# Altium schematic sheet P1.schdoc
size 297 x 209 mm; Symbol: Drawing-Symbol_A4; @Project Name: NAI-Lucifer PCB; @Page Count: 1; @Update Date: 2026-11-11; @Create Date: 2026-11-11; @Schematic Name: Schematic2; @Page No: 1; @Page Name: P1; Company: EasyEDA.com; Version: V1.0; Page Size: A4; Device: Drawing-Symbol_A4; @Create Time: 21:58:18; @Update Time: 21:58:18; Border: 1; Width: 1170; Height: 825; Region Start: 1; X Region Count: 6; Y Region Count: 4; Blade Width: 10; Title Block Position: 3
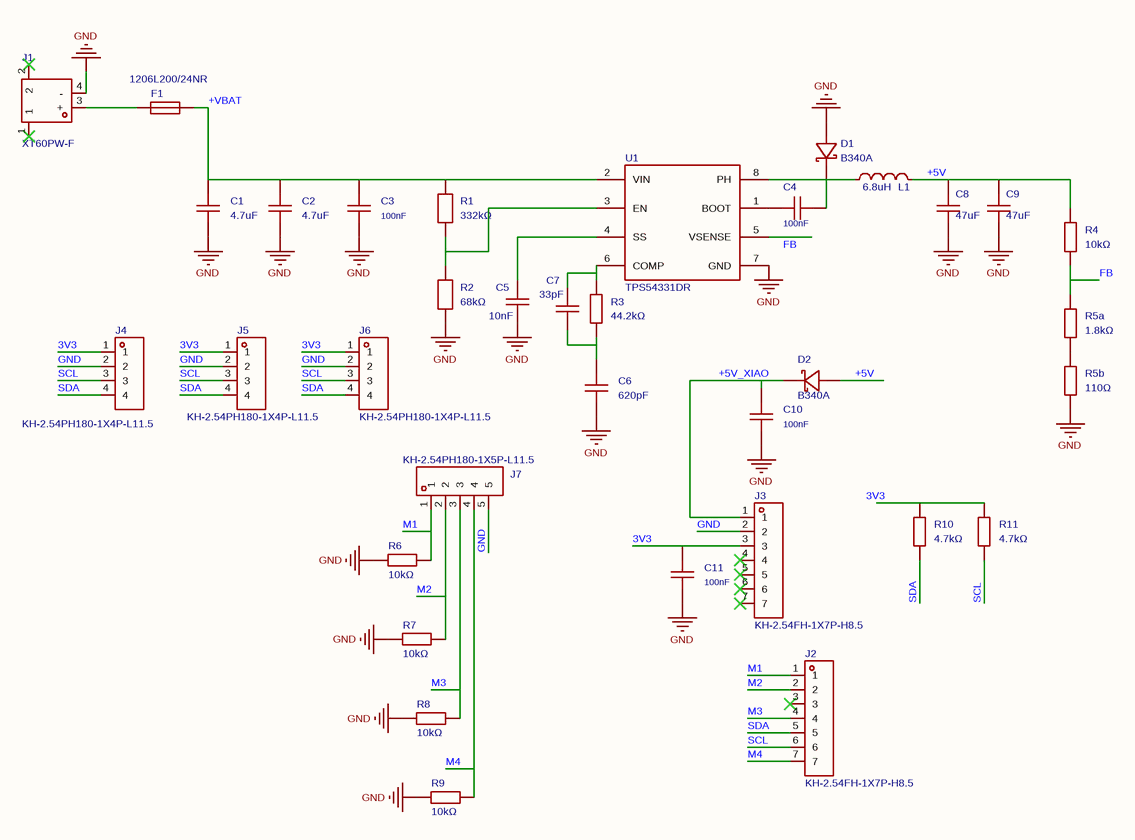
[diagram p0: P1.schdoc]

## Parts
C1  4.7uF  [C1210]
C2  4.7uF  [C1210]
C3  100nF  [C0603]
C4  100nF  [C0603]
C5  10nF  [C0603]
C6  620pF  [C0603]
C7  33pF  [C0603]
C8  47uF  [C1206]
C9  47uF  [C1206]
C10  100nF  [C0603]
C11  100nF  [C0603]
D1  B340A  [SMA_L4.3-W2.6-LS5.0-RD]
D2  B340A  [SMA_L4.3-W2.6-LS5.0-RD]
F1  1206L200/24NR  [F1206]
J1  XT60PW-F  [TH_2P-XT60PW-F]
J2  KH-2.54FH-1X7P-H8.5  [HDR-TH_7P-P2.54-V-F]
J3  KH-2.54FH-1X7P-H8.5  [HDR-TH_7P-P2.54-V-F]
J4  KH-2.54PH180-1X4P-L11.5  [HDR-TH_4P-P2.54-V-M]
J5  KH-2.54PH180-1X4P-L11.5  [HDR-TH_4P-P2.54-V-M]
J6  KH-2.54PH180-1X4P-L11.5  [HDR-TH_4P-P2.54-V-M]
J7  KH-2.54PH180-1X5P-L11.5  [HDR-TH_5P-P2.54-V-M]
L1  6.8uH  [IND-SMD_L7.0-W6.6]
R1  332kΩ  [R0603]
R2  68kΩ  [R0603]
R3  44.2kΩ  [R0603]
R4  10kΩ  [R0603]
R5a  1.8kΩ  [R0603]
R5b  110Ω  [R0603]
R6  10kΩ  [R0603]
R7  10kΩ  [R0603]
R8  10kΩ  [R0603]
R9  10kΩ  [R0603]
R10  4.7kΩ  [R0603]
R11  4.7kΩ  [R0603]
U1  TPS54331DR  [SOIC-8_L5.0-W4.0-P1.27-LS6.0-BL]

## Nets
GND: C1.2 C2.1 C3.1 C5.1 C6.1 C8.1 C9.2 C10.1 C11.1 D1.2(A) J1.4(-) J3.2 J4.2 J5.2 J6.2 J7.5 R2.1 R5b.1 R6.1 R7.2 R8.1 R9.1 U1.7(GND)
3V3: C11.2 J3.3 J4.1 J5.1 J6.1 R10.2 R11.2
+5V: C8.2 C9.1 D2.2(A) L1.2 R4.2
+5V_XIAO: C10.2 D2.1(K) J3.1
+VBAT: C1.1 C2.2 C3.2 F1.2 R1.2 U1.2(VIN)
FB: R4.1 R5a.2 U1.5(VSENSE)
M1: J2.1 J7.1 R6.2
M2: J2.2 J7.2 R7.1
M3: J2.4 J7.3 R8.2
M4: J2.7 J7.4 R9.2
SCL: J2.6 J4.3 J5.3 J6.3 R11.1
SDA: J2.5 J4.4 J5.4 J6.4 R10.1
NetC4_1: C4.1 D1.1(K) L1.1 U1.8(PH)
NetC4_2: C4.2 U1.1(BOOT)
NetC5_2: C5.2 U1.4(SS)
NetC6_2: C6.2 C7.1 R3.1
NetC7_2: C7.2 R3.2 U1.6(COMP)
NetF1_1: F1.1 J1.3(+)
NetR1_1: R1.1 R2.2 U1.3(EN)
NetR5a_1: R5a.1 R5b.2

Not connected (* = marked no-connect by the designer): J1 1* 2*; J2 3*; J3 4* 5* 6* 7*

## Notes on the sheet
- Create at
- 2026-11-11
- Schematic
- Board
- Schematic2
- Update at
- Page
- P1
- Drawn
- Reviewed
- NAI-Lucifer PCB
- Version
- V1.0
- Size
- A4
- Page  1  Total  1
- EasyEDA.com

## Library data of the parts
C1 = C1210C475K5RACTU: Capacitance:4.7uF Tolerance:±10% Tolerance:±10% Voltage Rating:50V Temperature Coefficient:X7R; Manufacturer: KEMET(基美); Check: true; AddInBom: yes; ModelId: 9bc01558702f4bd6b0b47bb74017b6c50819f05c4eef4c71ace90d822a990e87; ModelName: C1210_L3.2-W2.5-H2.5; ModelTransform: 125.984,98.425,0,0,0,0,0,0,0; Tolerance: ±10%; Voltage Rating: 50V; Temperature Coefficient: X7R; Symbol: C1210C475K5RACTU; Device: C1210C475K5RACTU; LCSC Part Name: 4.7uF ±10% 50V; SupplierPart: C2182224; ManufacturerPart: C1210C475K5RACTU; Supplier Footprint: 1210; JLCPCB Part Class: Extended Part; Datasheet: https://item.szlcsc.com/datasheet/C1210C475K5RACTU/2274291.html; Supplier: LCSC; ConvertToPcb: yes; FootprintName: C1210; Value: 4.7uF
C2 = C1210C475K5RACTU: Capacitance:4.7uF Tolerance:±10% Tolerance:±10% Voltage Rating:50V Temperature Coefficient:X7R; Manufacturer: KEMET(基美); Check: true; 3D Model: 9bc01558702f4bd6b0b47bb74017b6c50819f05c4eef4c71ace90d822a990e87; 3D Model Transform: 125.984,98.425,0,0,0,0,0,0,0; Tolerance: ±10%; Voltage Rating: 50V; Temperature Coefficient: X7R; AddInBom: yes; ModelName: C1210_L3.2-W2.5-H2.5; Symbol: C1210C475K5RACTU; Device: C1210C475K5RACTU; LCSC Part Name: 4.7uF ±10% 50V; Supplier Part: C2182224; Manufacturer Part: C1210C475K5RACTU; Supplier Footprint: 1210; JLCPCB Part Class: Extended Part; Datasheet: https://item.szlcsc.com/datasheet/C1210C475K5RACTU/2274291.html; Supplier: LCSC; Value: 4.7uF; ConvertToPcb: yes; FootprintName: C1210
C3 C4 C10 C11 = CC0603KRX7R9BB104: Capacitance:100nF Tolerance:±10% Tolerance:±10% Voltage Rating:50V Temperature Coefficient:X7R; Manufacturer: YAGEO(国巨); Check: true; 3D Model: 624118aa3cc7497086c383c2d72e08520819f05c4eef4c71ace90d822a990e87; 3D Model Transform: 62.992,31.496,0,0,0,0,0,0,0; Tolerance: ±10%; Voltage Rating: 50V; Temperature Coefficient: X7R; AddInBom: yes; ModelName: C0603_L1.6-W0.8-H0.8; Symbol: CC0603KRX7R9BB104; Device: CC0603KRX7R9BB104; LCSC Part Name: 100nF ±10% 50V; Supplier Part: C14663; Manufacturer Part: CC0603KRX7R9BB104; Supplier Footprint: 0603; JLCPCB Part Class: Basic Part; Datasheet: https://item.szlcsc.com/datasheet/CC0603KRX7R9BB104/15331.html; Supplier: LCSC; Value: 100nF; ConvertToPcb: yes; FootprintName: C0603
C5 = CL10B103KB8NNNC: Capacitance:10nF Tolerance:±10% Tolerance:±10% Voltage Rating:50V Temperature Coefficient:X7R; Manufacturer: SAMSUNG(三星); Check: true; 3D Model: 624118aa3cc7497086c383c2d72e08520819f05c4eef4c71ace90d822a990e87; 3D Model Transform: 62.992,31.496,0,0,0,0,0,0,0; Tolerance: ±10%; Voltage Rating: 50V; Temperature Coefficient: X7R; AddInBom: yes; ModelName: C0603_L1.6-W0.8-H0.8; Symbol: CL10B103KB8NNNC; Device: CL10B103KB8NNNC; LCSC Part Name: 10nF ±10% 50V; Supplier Part: C1589; Manufacturer Part: CL10B103KB8NNNC; Supplier Footprint: 0603; JLCPCB Part Class: Extended Part; Datasheet: https://item.szlcsc.com/datasheet/CL10B103KB8NNNC/1941.html; Supplier: LCSC; Value: 10nF; ConvertToPcb: yes; FootprintName: C0603
C6 = GRM1885C1H621JA01D: Capacitance: Tolerance:±5% Tolerance:±5% Voltage Rated: Temperature Coefficient:; Manufacturer: muRata(村田); Check: true; AddInBom: yes; ModelId: 624118aa3cc7497086c383c2d72e08520819f05c4eef4c71ace90d822a990e87; ModelName: C0603_L1.6-W0.8-H0.8; ModelTransform: 62.992,31.496,0,0,0,0,0,0,0; Tolerance: ±5%; Symbol: GRM1885C1H621JA01D; Device: GRM1885C1H621JA01D; LCSC Part Name: 620pF ±5% 50V; SupplierPart: C527998; ManufacturerPart: GRM1885C1H621JA01D; Supplier Footprint: 0603; JLCPCB Part Class: Extended Part; Datasheet: https://atta.szlcsc.com/upload/public/pdf/source/20200407/C503309_0211D99E6F86B2657E389DD3F8367252.pdf; Supplier: LCSC; ConvertToPcb: yes; FootprintName: C0603; Value: 620pF
C7 = CL10C330JB8NNNC: Capacitance:33pF Tolerance:±5% Tolerance:±5% Voltage Rating:50V Temperature Coefficient:C0G; Manufacturer: SAMSUNG(三星); Check: true; AddInBom: yes; ModelId: 624118aa3cc7497086c383c2d72e08520819f05c4eef4c71ace90d822a990e87; ModelName: C0603_L1.6-W0.8-H0.8; ModelTransform: 62.992,31.496,0,0,0,0,0,0,0; Tolerance: ±5%; Voltage Rating: 50V; Temperature Coefficient: C0G; Symbol: CL10C330JB8NNNC; Device: CL10C330JB8NNNC; Supplier: LCSC; Manufacturer Part: CL10C330JB8NNNC; Value: 33pF; Supplier Part: C1663; JLCPCB Part Class: Basic Part; LCSC Part Name: 33pF ±5% 50V; Supplier Footprint: 0603; Datasheet: https://item.szlcsc.com/datasheet/CL10C330JB8NNNC/2015.html; ConvertToPcb: yes; FootprintName: C0603
C8 = CL31A476MPHNNNE: Capacitance:47uF Tolerance:±20% Tolerance:±20% Voltage Rating:10V Temperature Coefficient:X5R; Manufacturer: SAMSUNG(三星); Check: true; 3D Model: c6790e9475e1483991d2c64340b24e960819f05c4eef4c71ace90d822a990e87; 3D Model Transform: 125.984,62.992,0,0,0,0,0,0,0; Tolerance: ±20%; Voltage Rating: 10V; Temperature Coefficient: X5R; AddInBom: yes; ModelName: C1206_L3.2-W1.6-H1.3; Symbol: CL31A476MPHNNNE; Device: CL31A476MPHNNNE; LCSC Part Name: 47uF ±20% 10V; Supplier Part: C96123; Manufacturer Part: CL31A476MPHNNNE; Supplier Footprint: 1206; JLCPCB Part Class: Basic Part; Datasheet: https://item.szlcsc.com/datasheet/CL31A476MPHNNNE/97327.html; Supplier: LCSC; Value: 47uF; ConvertToPcb: yes; FootprintName: C1206
C9 = CL31A476MPHNNNE: Capacitance:47uF Tolerance:±20% Tolerance:±20% Voltage Rating:10V Temperature Coefficient:X5R; Manufacturer: SAMSUNG(三星); Check: true; AddInBom: yes; ModelId: c6790e9475e1483991d2c64340b24e960819f05c4eef4c71ace90d822a990e87; ModelName: C1206_L3.2-W1.6-H1.3; ModelTransform: 125.984,62.992,0,0,0,0,0,0,0; Tolerance: ±20%; Voltage Rating: 10V; Temperature Coefficient: X5R; Symbol: CL31A476MPHNNNE; Device: CL31A476MPHNNNE; LCSC Part Name: 47uF ±20% 10V; SupplierPart: C96123; ManufacturerPart: CL31A476MPHNNNE; Supplier Footprint: 1206; JLCPCB Part Class: Basic Part; Datasheet: https://item.szlcsc.com/datasheet/CL31A476MPHNNNE/97327.html; Supplier: LCSC; ConvertToPcb: yes; FootprintName: C1206; Value: 47uF
D1 D2 = B340A_C3018525: Forward Voltage (Vf@If):550mV@3A Reverse Voltage (Vr):40V Average Rectified Current (Io):3A Reverse Leakage Current (Ir):500uA@40V; Manufacturer: FUXINSEMI(富芯森美); Check: true; AddInBom: yes; ModelId: 350a5e503cd74372b99758d92a4eb3ec0819f05c4eef4c71ace90d822a990e87; ModelTransform: 196.85,102.362,0,0,0,0,0,0,0; Reverse Voltage (Vr): 40V; Average Rectified Current (Io): 3A; Symbol: B340A_C3018525; Device: B340A_C3018525; LCSC Part Name: 电压:40V 电流:3A; SupplierPart: C3018525; ManufacturerPart: B340A; Supplier Footprint: SMA(DO-214AC); JLCPCB Part Class: Extended Part; Datasheet: https://atta.szlcsc.com/upload/public/pdf/source/20220530/48889337C27311960E6F9D350CFD44EF.pdf; Supplier: LCSC; ConvertToPcb: yes; FootprintName: SMA_L4.3-W2.6-LS5.0-RD; ModelName: SMA_L4.3-W2.6-LS5.0-RD; Forward Voltage (Vf@If): 550mV@3A; Reverse Leakage Current (Ir): 500uA@40V
F1 = 1206L200/24NR: Voltage - Max:24V Current - Max:40A Hold Current:2A Trip Current:3.5A Power Dissipation:1.2W Resistance - Initial (Ri) (Min):15mΩ Resistance - Post Trip (R1) (Max):80mΩ Time to Trip(Max):1.5s Operating Temperature:-40℃~+85℃ Operating Temperature:-40℃~+85℃; Manufacturer: LUTE(陆特); Check: true; AddInBom: yes; ModelId: 61372169742747e19cbd4ac5ee5e48b10819f05c4eef4c71ace90d822a990e87; ModelName: F1206_L3.2-W1.7-H0.6; ModelTransform: 125.984,66.929,0,0,0,0,0,0,0; Voltage - Max: 24V; Current - Max: 40A; Hold Current: 2A; Trip Current: 3.5A; Power Dissipation: 1.2W; Resistance - Initial (Ri) (Min): 15mΩ; Resistance - Post Trip (R1) (Max): 80mΩ; Time to Trip(Max): 1.5s; Symbol: 1206L200/24NR; Device: 1206L200/24NR; LCSC Part Name: 24V 2.00A 1206 自恢复; SupplierPart: C42396578; ManufacturerPart: 1206L200/24NR; Supplier Footprint: 1206; JLCPCB Part Class: Extended Part; Datasheet: https://item.szlcsc.com/datasheet/1206L200%252F24NR/44344788.html; Supplier: LCSC; ConvertToPcb: yes; FootprintName: F1206; Operating Temperature: -40℃~+85℃; Length: 3.6mm; Width: 1.9mm; Height: 1.6mm; Pitch: -
J1 = XT60PW-F: colour:Yellow Connector type:Horizontal plug interface form:Female; Manufacturer: AMASS(艾迈斯); Check: true; Symbol: XT60PW-F_C428722; AddInBom: yes; ModelId: 5394980244ce4cef9ccf9501250f7db70819f05c4eef4c71ace90d822a990e87; ModelTransform: 610.235,677.164,0,0,0,0,-2.4,150.43,-149.606; interface form: Female; Device: XT60PW-F; LCSC Part Name: AMASS(艾迈斯)插头锂电池组充电接头 线到板连接器大电流30A连接器 航模电调卧式焊板 母头XT60PW-F.G.Y; SupplierPart: C428722; ManufacturerPart: XT60PW-F; Supplier Footprint: -; JLCPCB Part Class: Extended Part; Datasheet: https://item.szlcsc.com/datasheet/XT60PW-F/423834.html; Supplier: LCSC; ConvertToPcb: yes; FootprintName: TH_2P-XT60PW-F; ModelName: TH_2P-XT60PW-F; colour: Yellow; Connector type: Horizontal plug
J2 J3 = KH-2.54FH-1X7P-H8.5: Holes Structure:1x7P Pitch:2.54mm Row Spacing:- Circular Hole / Square Hole:Square Hole Mounting Type:Through Hole Number of Rows:1 Number of Positions:7P Current Rating:3A Voltage Rating (Max):- Holes Direction:Top Insulation Height:8.5mm Contact Materia; Manufacturer: kinghelm(金航标); Check: true; AddInBom: yes; ModelId: 12ee6e43c8c540869f0518a7af89635d0819f05c4eef4c71ace90d822a990e87; ModelName: HDR-TH_7P-P2.54-F-LI-1X7P; ModelTransform: 715.7466,94.488,0,0,0,0,0,0,-118.11; Holes Structure: 1x7P; Pitch: 2.54mm; Number of Positions: 7P; Current Rating: 3A; Holes Direction: Top; PIN Length: 3mm; Symbol: KH-2.54FH-1X7P-H8.5; Device: KH-2.54FH-1X7P-H8.5; LCSC Part Name: 1x7P 间距:2.54mm 直插; SupplierPart: C2932672; ManufacturerPart: KH-2.54FH-1X7P-H8.5; Supplier Footprint: 插件,P=2.54mm; JLCPCB Part Class: Extended Part; Datasheet: https://item.szlcsc.com/datasheet/KH-2.54FH-1X7P-H8.5/3278193.html; Supplier: LCSC; ConvertToPcb: yes; FootprintName: HDR-TH_7P-P2.54-V-F; Row Spacing: -; Circular Hole / Square Hole: Square Hole; Mounting Type: Through Hole; Number of Rows: 1; Voltage Rating (Max): -; Insulation Height: 8.5mm; Contact Material: Brass; Contact Plating: Gold; Operating Temperature: -40℃~+105℃
J4-J6 = KH-2.54PH180-1X4P-L11.5: Pin Structure:1x4P Pitch:2.54mm Row Spacing:- Circluar Pins/Square Pins:Pin Header Mounting Type:Through Hole Number of Rows:1 Number of Pins:4P Current Rating:3A Voltage Rating (Max):- Length of Mating Pin:6mm Insulation Height:2.5mm Length of End Connec; Manufacturer: kinghelm(金航标); Check: true; AddInBom: yes; ModelId: 69e0934d9b9245f6ab499bc5a319b3aa0819f05c4eef4c71ace90d822a990e87; ModelName: HDR-TH_4P-P2.54-M-LI-1X4P; ModelTransform: 399.999,104.7242,0,0,0,0,0,0,-118.11; Pin Structure: 1x4P; Pitch: 2.54mm; Current Rating: 3A; Symbol: KH-2.54PH180-1X4P-L11.5; Device: KH-2.54PH180-1X4P-L11.5; LCSC Part Name: 1x4P 间距:2.54mm 方针 直插; SupplierPart: C2905435; ManufacturerPart: KH-2.54PH180-1X4P-L11.5; Supplier Footprint: 插件,P=2.54mm; JLCPCB Part Class: Extended Part; Datasheet: https://item.szlcsc.com/datasheet/KH-2.54PH180-1X4P-L11.5/3175223.html; Supplier: LCSC; ConvertToPcb: yes; FootprintName: HDR-TH_4P-P2.54-V-M; Row Spacing: -; Circluar Pins/Square Pins: Pin Header; Mounting Type: Through Hole; Number of Rows: 1; Number of Pins: 4P; Voltage Rating (Max): -; Length of Mating Pin: 6mm; Insulation Height: 2.5mm; Length of End Connection Pin: 3mm; Contact Material: -; Operating Temperature: -40℃~+105℃; Color: Black
J7 = KH-2.54PH180-1X5P-L11.5: Pin Structure:1x5P Pitch:2.54mm Row Spacing:- Circluar Pins/Square Pins:Pin Header Mounting Type:Through Hole Number of Rows:1 Number of Pins:5P Current Rating:3A Voltage Rating (Max):- Length of Mating Pin:6mm Insulation Height:2.5mm Length of End Connec; Manufacturer: kinghelm(金航标); Check: true; AddInBom: yes; ModelId: 98c612b43cbb479a86eae3328ff22ecc0819f05c4eef4c71ace90d822a990e87; ModelName: HDR-TH_5P-P2.54-M-LI-1X5P; ModelTransform: 499.999,100,0,0,0,0,0,0,-118.11; Pin Structure: 1x5P; Pitch: 2.54mm; Current Rating: 3A; Symbol: KH-2.54PH180-1X5P-L11.5; Device: KH-2.54PH180-1X5P-L11.5; LCSC Part Name: 1x5P 间距:2.54mm 方针 直插; SupplierPart: C2932699; ManufacturerPart: KH-2.54PH180-1X5P-L11.5; Supplier Footprint: 插件,P=2.54mm; JLCPCB Part Class: Extended Part; Datasheet: https://item.szlcsc.com/datasheet/KH-2.54PH180-1X5P-L11.5/3278220.html; Supplier: LCSC; ConvertToPcb: yes; FootprintName: HDR-TH_5P-P2.54-V-M; Row Spacing: -; Circluar Pins/Square Pins: Pin Header; Mounting Type: Through Hole; Number of Rows: 1; Number of Pins: 5P; Voltage Rating (Max): -; Length of Mating Pin: 6mm; Insulation Height: 2.5mm; Length of End Connection Pin: 3mm; Operating Temperature: -40℃~+105℃; Color: Black
L1 = TMPC0624H-6R8MG-D: Inductance: Tolerance:±20% Tolerance:±20% Rated Current: Saturation Current (Isat):7A DC Resistance (DCR):; Manufacturer: TAI-TECH(台庆); Check: true; AddInBom: yes; ModelId: c5f8ba9cccaa467b9f226b80eb77c8b30819f05c4eef4c71ace90d822a990e87; ModelName: IND-SMD_L7.0-W6.6-H3.0; ModelTransform: 275.59,259.88137,0,0,0,0,0,0,0; Tolerance: ±20%; Saturation Current (Isat): 7A; Symbol: TMPC0624H-6R8MG-D; Device: TMPC0624H-6R8MG-D; LCSC Part Name: 6.8uH ±20% 7A; SupplierPart: C357230; ManufacturerPart: TMPC0624H-6R8MG-D; Supplier Footprint: SMD,7x6.6mm; JLCPCB Part Class: Extended Part; Datasheet: https://atta.szlcsc.com/upload/public/pdf/source/20200917/C357230_D0E636AD8F4F6E55E8FC0BE9190F699A.pdf; Supplier: LCSC; ConvertToPcb: yes; FootprintName: IND-SMD_L7.0-W6.6; Value: 6.8uH
R1 = RMCF0603FT332K: Type:Thick Film Resistor Resistance:332kΩ Tolerance:±1% Tolerance:±1% Power(Watts):100mW Temperature Coefficient:±100ppm/℃ Temperature Coefficient:±100ppm/℃ Operating Temperature:-55℃~+155℃ Operating Temperature:-55℃~+155℃; Manufacturer: SEI(Stackpole Electronics Inc.); Check: true; AddInBom: yes; ModelId: 112863783b5b41f1b5254f87eedc79320819f05c4eef4c71ace90d822a990e87; ModelTransform: 31.8897,63.7794,0,90,0,0,0,0,0; Tolerance: ±1%; Power(Watts): 100mW; Symbol: RMCF0603FT332K; Device: RMCF0603FT332K; LCSC Part Name: 厚膜电阻 332kΩ ±1% 100mW; SupplierPart: C3994408; ManufacturerPart: RMCF0603FT332K; Supplier Footprint: 0603; JLCPCB Part Class: Extended Part; Datasheet: https://item.szlcsc.com/datasheet/RMCF0603FT332K/4563600.html; Supplier: LCSC; ConvertToPcb: yes; FootprintName: R0603; ModelName: R0603; Type: Thick Film Resistor; Value: 332kΩ; Temperature Coefficient: ±100ppm/℃; Operating Temperature: -55℃~+155℃
R2 = FRC0603F6802TS: Type:Thick Film Resistor Resistance:68kΩ Tolerance:±1% Tolerance:±1% Power(Watts):100mW Voltage-Supply(Max):75V Temperature Coefficient:±100ppm/℃ Temperature Coefficient:±100ppm/℃ Operating Temperature:-55℃~+155℃ Operating Temperature:-55℃~+155℃; Manufacturer: FOJAN(富捷); Check: true; AddInBom: yes; ModelId: 112863783b5b41f1b5254f87eedc79320819f05c4eef4c71ace90d822a990e87; ModelTransform: 31.8897,63.7794,0,90,0,0,0,0,0; Tolerance: ±1%; Power(Watts): 100mW; Voltage-Supply(Max): 75V; Symbol: FRC0603F6802TS; Device: FRC0603F6802TS; LCSC Part Name: 68kΩ ±1% 100mW 厚膜电阻; SupplierPart: C2907063; ManufacturerPart: FRC0603F6802TS; Supplier Footprint: 0603; JLCPCB Part Class: Extended Part; Supplier: LCSC; ConvertToPcb: yes; FootprintName: R0603; ModelName: R0603; Type: Thick Film Resistor; Value: 68kΩ; Temperature Coefficient: ±100ppm/℃; Operating Temperature: -55℃~+155℃
R3 = RK73H1JTTD4422F: Type:Thick Film Resistor Resistance:44.2kΩ Tolerance:±1% Tolerance:±1% Power(Watts):100mW Voltage-Supply(Max):75V Temperature Coefficient:±100ppm/℃ Temperature Coefficient:±100ppm/℃ Operating Temperature:-55℃~+155℃ Operating Temperature:-55℃~+155℃; Manufacturer: KOA; Check: true; AddInBom: yes; ModelId: 112863783b5b41f1b5254f87eedc79320819f05c4eef4c71ace90d822a990e87; ModelTransform: 31.8897,63.7794,0,90,0,0,0,0,0; Tolerance: ±1%; Power(Watts): 100mW; Voltage-Supply(Max): 75V; Symbol: RK73H1JTTD4422F; Device: RK73H1JTTD4422F; LCSC Part Name: 厚膜电阻 44.2kΩ ±1% 100mW; SupplierPart: C317170; ManufacturerPart: RK73H1JTTD4422F; Supplier Footprint: 0603; JLCPCB Part Class: Extended Part; Datasheet: https://item.szlcsc.com/datasheet/RK73H1JTTD4422F/298752.html; Supplier: LCSC; ConvertToPcb: yes; FootprintName: R0603; ModelName: R0603; Type: Thick Film Resistor; Value: 44.2kΩ; Temperature Coefficient: ±100ppm/℃; Operating Temperature: -55℃~+155℃
R4 R6-R9 = 0603WAF1002T5E: Type:Thick Film Resistor Resistance:10kΩ Tolerance:±1% Tolerance:±1% Power(Watts):100mW Voltage-Supply(Max):75V Temperature Coefficient:±100ppm/℃ Temperature Coefficient:±100ppm/℃ Operating Temperature:-55℃~+155℃ Operating Temperature:-55℃~+155℃; Manufacturer: UNI-ROYAL(厚声); Check: true; 3D Model: 112863783b5b41f1b5254f87eedc79320819f05c4eef4c71ace90d822a990e87; 3D Model Transform: 31.8897,63.7794,0,90,0,0,0,0,0; Tolerance: ±1%; Power(Watts): 100mW; Voltage-Supply(Max): 75V; AddInBom: yes; Symbol: 0603WAF1002T5E; Device: 0603WAF1002T5E; LCSC Part Name: 厚膜电阻 10kΩ ±1% 100mW; Supplier Part: C25804; Manufacturer Part: 0603WAF1002T5E; Supplier Footprint: 0603; JLCPCB Part Class: Basic Part; Datasheet: https://item.szlcsc.com/datasheet/0603WAF1002T5E/26547.html; Supplier: LCSC; Type: Thick Film Resistor; Value: 10kΩ; Temperature Coefficient: ±100ppm/℃; Operating Temperature: -55℃~+155℃; ConvertToPcb: yes; FootprintName: R0603; ModelName: R0603
R5a = 0603WAF1801T5E: Type:Thick Film Resistor Resistance:1.8kΩ Tolerance:±1% Tolerance:±1% Power(Watts):100mW Voltage-Supply(Max):75V Temperature Coefficient:±100ppm/℃ Temperature Coefficient:±100ppm/℃ Operating Temperature:-55℃~+155℃ Operating Temperature:-55℃~+155℃; Manufacturer: UNI-ROYAL(厚声); Check: true; AddInBom: yes; ModelId: 112863783b5b41f1b5254f87eedc79320819f05c4eef4c71ace90d822a990e87; ModelTransform: 31.8897,63.7794,0,90,0,0,0,0,0; Tolerance: ±1%; Power(Watts): 100mW; Voltage-Supply(Max): 75V; Symbol: 0603WAF1801T5E; Device: 0603WAF1801T5E; Supplier: LCSC; Manufacturer Part: 0603WAF1801T5E; Supplier Part: C4177; Value: 1.8kΩ; JLCPCB Part Class: Basic Part; LCSC Part Name: 厚膜电阻 1.8kΩ ±1%; Supplier Footprint: 0603; Datasheet: https://item.szlcsc.com/datasheet/0603WAF1801T5E/4584.html; ConvertToPcb: yes; FootprintName: R0603; ModelName: R0603; Type: Thick Film Resistor; Temperature Coefficient: ±100ppm/℃; Operating Temperature: -55℃~+155℃
R5b = HPCR0603F110RK9: Type:Thick Film Resistor Resistance:110Ω Tolerance:±1% Tolerance:±1% Power(Watts):125mW Voltage-Supply(Max):50V Temperature Coefficient:±100ppm/℃ Temperature Coefficient:±100ppm/℃ Operating Temperature:-55℃~+125℃ Operating Temperature:-55℃~+125℃; Manufacturer: RESI(开步睿思); Check: true; AddInBom: yes; ModelId: 112863783b5b41f1b5254f87eedc79320819f05c4eef4c71ace90d822a990e87; ModelTransform: 31.8897,63.7794,0,90,0,0,0,0,0; Tolerance: ±1%; Power(Watts): 125mW; Voltage-Supply(Max): 50V; Symbol: HPCR0603F110RK9; Device: HPCR0603F110RK9; LCSC Part Name: 厚膜电阻 110Ω ±1% 125mW; SupplierPart: C365068; ManufacturerPart: HPCR0603F110RK9; Supplier Footprint: 0603; JLCPCB Part Class: Extended Part; Datasheet: https://item.szlcsc.com/datasheet/HPCR0603F110RK9/339284.html; Supplier: LCSC; ConvertToPcb: yes; FootprintName: R0603; ModelName: R0603; Type: Thick Film Resistor; Value: 110Ω; Temperature Coefficient: ±100ppm/℃; Operating Temperature: -55℃~+125℃
R10 R11 = 0603WAF4701T5E: Type:Thick Film Resistor Resistance:4.7kΩ Tolerance:±1% Tolerance:±1% Power(Watts):100mW Voltage-Supply(Max):75V Temperature Coefficient:±100ppm/℃ Temperature Coefficient:±100ppm/℃ Operating Temperature:-55℃~+155℃ Operating Temperature:-55℃~+155℃; Manufacturer: UNI-ROYAL(厚声); Check: true; AddInBom: yes; ModelId: 112863783b5b41f1b5254f87eedc79320819f05c4eef4c71ace90d822a990e87; ModelTransform: 31.8897,63.7794,0,90,0,0,0,0,0; Tolerance: ±1%; Power(Watts): 100mW; Voltage-Supply(Max): 75V; Symbol: 0603WAF4701T5E; Device: 0603WAF4701T5E; LCSC Part Name: 厚膜电阻 4.7kΩ ±1%; SupplierPart: C23162; ManufacturerPart: 0603WAF4701T5E; Supplier Footprint: 0603; JLCPCB Part Class: Basic Part; Datasheet: https://item.szlcsc.com/datasheet/0603WAF4701T5E/23889.html; Supplier: LCSC; ConvertToPcb: yes; FootprintName: R0603; ModelName: R0603; Type: Thick Film Resistor; Value: 4.7kΩ; Temperature Coefficient: ±100ppm/℃; Operating Temperature: -55℃~+155℃
U1 = TPS54331DR: Function:Step-down type Voltage - Supply:3.5V~28V Voltage - Supply:3.5V~28V Output Voltage:800mV~25V Output Voltage:800mV~25V Output Current:3A Frequency - Switching:570kHz Frequency - Switching:570kHz Operating Temperature:-40℃~+150℃@(TJ) Operating Tempe; Manufacturer: TI(德州仪器); Check: true; AddInBom: yes; ModelId: 7abc64c95a1a4a04a4ef38f9097c870b0819f05c4eef4c71ace90d822a990e87; ModelTransform: 192.913,236.22,0,0,0,0,0,0,0; Output Current: 3A; Frequency - Switching: 570kHz; Synchronous Rectifier: No; Number of Outputs: 1; Topology: Buck; Quiescent Current: 110uA; Switch tube (built-in/external): Built-in; Output Type: Adjustable; Symbol: TPS54331DR; Device: TPS54331DR; LCSC Part Name: 降压型 3A 3.5V~28V; SupplierPart: C9865; ManufacturerPart: TPS54331DR; Supplier Footprint: SOIC-8; JLCPCB Part Class: Extended Part; Datasheet: https://www.ti.com/cn/lit/ds/symlink/tps54331.pdf; Supplier: LCSC; ConvertToPcb: yes; FootprintName: SOIC-8_L5.0-W4.0-P1.27-LS6.0-BL; ModelName: SOIC-8_L5.0-W4.0-P1.27-LS6.0-BL; Function: Step-down type; Voltage - Supply: 3.5V~28V; Output Voltage: 800mV~25V; Operating Temperature: -40℃~+150℃@(TJ); Features: Light load efficient mode；External compensation；Cycle-by-cycle current limiting；Adjustable soft-start；Overcurrent Protection